# Altium schematic sheet GPIO_NC_INTERFACE.SchDoc
size A4; SheetNumber: 13; SheetTotal: 20
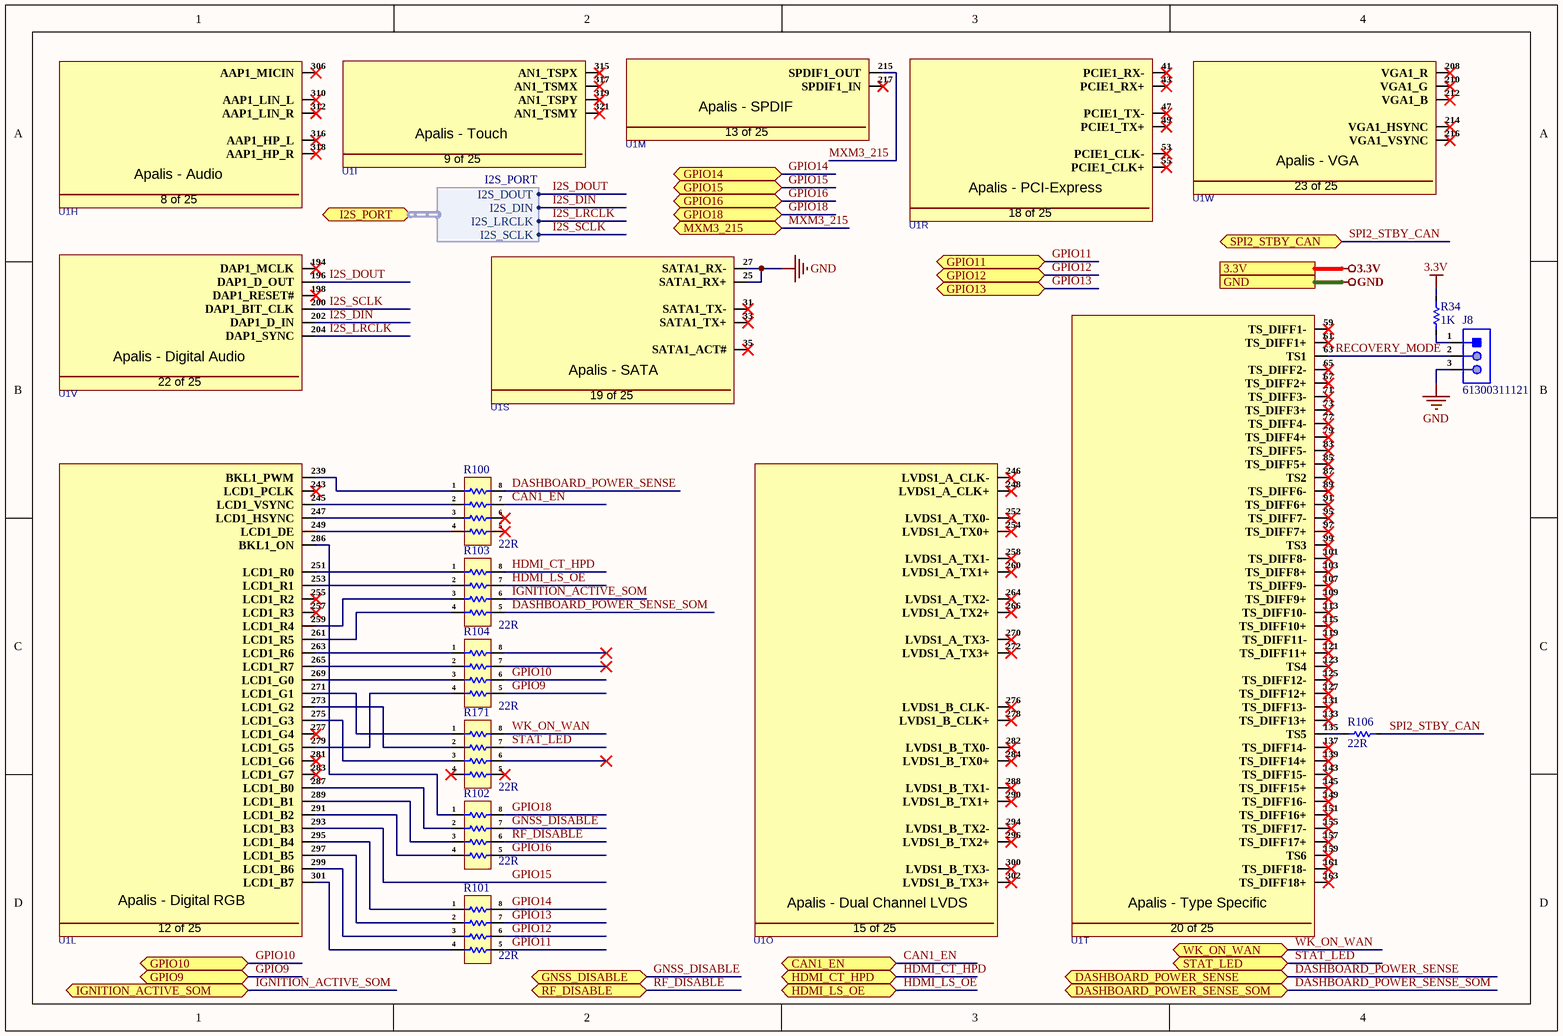
[diagram p0: GPIO_NC_INTERFACE.SchDoc]

## Parts
J8  61300311121  [HDR1X3_]
R34  1K  [Res-0603]
R100  22R  [YC164-JR-0722RL]
R101  22R  [YC164-JR-0722RL]
R102  22R  [YC164-JR-0722RL]
R103  22R  [YC164-JR-0722RL]
R104  22R  [YC164-JR-0722RL]
R106  22R  [Res-0402]
R171  22R  [YC164-JR-0722RL]
U1  MM70-314B1-2-R300  [MM70-314B1-2-R300]  (value not drawn)  (parts H,I,L,M,O,R,S,T,V,W of 25)

## Ports
3.3V (see Top_Sheet[3B], 03-CAN2_SPI_CAN_CONTROLLER[1D], APALIS_POWER_SUPPLY[1D], CAN2_SPI_CAN_CONTROLLER[1D], DC_DC_CONVERTER[1D], I2C_INTERFACE[1B], LTE_MODULE[1D], Reset_and_SDIO[1D]), CAN1_EN (bidir, see Top_Sheet[2B], 03-CAN2_SPI_CAN_CONTROLLER[1D]), DASHBOARD_POWER_SENSE (bidir, see Top_Sheet[3B], CONNECTORS[3D], DIGITAL_I-O_O-P[1D]), DASHBOARD_POWER_SENSE_SOM (bidir, see Top_Sheet[3B], DIGITAL_I-O_O-P[1D]), GND (see Top_Sheet[2B], 03-CAN2_SPI_CAN_CONTROLLER[1D], APALIS_POWER_SUPPLY[1D], CAN2_SPI_CAN_CONTROLLER[1D], CODEC_INTERFACE[1D], CONNECTORS[1D], DC_DC_CONVERTER[1D], DIGITAL_I-O_O-P[1D], ETHERNET_INTERFACE[1D], FUTURE_USE_CONNECTOR[1D], HDMI_INTERFACE[1D], I2C_INTERFACE[1B], INPUT_SUPPLY_PROTECTION[1D], LTE_MODULE[1D], MECHANICAL_FOR_PCB[1D], MICRO_SD_CARD_INTERFACE[1D], Reset_and_SDIO[1D], UART_INTERFACE[1D], USB3.0_INTERFACE[1D]), GNSS_DISABLE (bidir, see Top_Sheet[3C], LTE_MODULE[3D]), GPIO9 (bidir, see Top_Sheet[2C], CONNECTORS[2D], FUTURE_USE_CONNECTOR[3C]), GPIO10 (bidir, see Top_Sheet[2C], FUTURE_USE_CONNECTOR[3C]), GPIO11 (bidir, see Top_Sheet[2C], CONNECTORS[2D], FUTURE_USE_CONNECTOR[3C]), GPIO12 (bidir, see Top_Sheet[2C], CONNECTORS[2D], FUTURE_USE_CONNECTOR[3C]), GPIO13 (bidir, see Top_Sheet[2C], CONNECTORS[2D], FUTURE_USE_CONNECTOR[3C]), GPIO14 (bidir, see Top_Sheet[2C], FUTURE_USE_CONNECTOR[3C]), GPIO15 (bidir, see Top_Sheet[3C], FUTURE_USE_CONNECTOR[3C]), GPIO16 (bidir, see Top_Sheet[3C], FUTURE_USE_CONNECTOR[3D]), GPIO18 (bidir, see Top_Sheet[3B], DIGITAL_I-O_O-P[1D]), HDMI_CT_HPD (bidir, see Top_Sheet[2B], HDMI_INTERFACE[1D]), HDMI_LS_OE (bidir, see Top_Sheet[2C], HDMI_INTERFACE[1D]), I2S_PORT (bidir, harness I2S_PORT, see Top_Sheet[3C], CODEC_INTERFACE[2D]), IGNITION_ACTIVE_SOM (bidir, see Top_Sheet[2C], DIGITAL_I-O_O-P[1D]), MXM3_215 (bidir, see Top_Sheet[3B], CODEC_INTERFACE[4D]), RF_DISABLE (bidir, see Top_Sheet[3C], LTE_MODULE[3D]), SPI2_STBY_CAN (bidir, see Top_Sheet[2C], CAN2_SPI_CAN_CONTROLLER[1D]), STAT_LED (bidir, see Top_Sheet[3C], LTE_MODULE[3D]), WK_ON_WAN (bidir, see Top_Sheet[3C], LTE_MODULE[3D])

## Harnesses
I2S_PORT: I2S_DOUT, I2S_DIN, I2S_LRCLK, I2S_SCLK

## Nets
3.3V: R34.2 ; port 3.3V
GND: J8.3 U1.25(SATA1_RX+) U1.27(SATA1_RX-) ; port GND
CAN1_EN: R100.7 ; port CAN1_EN
DASHBOARD_POWER_SENSE: R100.8 ; port DASHBOARD_POWER_SENSE
DASHBOARD_POWER_SENSE_SOM: R103.5 ; port DASHBOARD_POWER_SENSE_SOM
GNSS_DISABLE: R102.7 ; port GNSS_DISABLE
GPIO9: R104.5 ; port GPIO9
GPIO10: R104.6 ; port GPIO10
GPIO11: R101.5 ; port GPIO11
GPIO12: R101.6 ; port GPIO12
GPIO13: R101.7 ; port GPIO13
GPIO14: R101.8 ; port GPIO14
GPIO15: U1.293(LCD1_B3) ; port GPIO15
GPIO16: R102.5 ; port GPIO16
GPIO18: R102.8 ; port GPIO18
HDMI_CT_HPD: R103.8 ; port HDMI_CT_HPD
HDMI_LS_OE: R103.7 ; port HDMI_LS_OE
I2S_DIN: U1.202(DAP1_D_IN) ; port I2S_PORT.I2S_DIN
I2S_DOUT: U1.196(DAP1_D_OUT) ; port I2S_PORT.I2S_DOUT
I2S_LRCLK: U1.204(DAP1_SYNC) ; port I2S_PORT.I2S_LRCLK
I2S_SCLK: U1.200(DAP1_BIT_CLK) ; port I2S_PORT.I2S_SCLK
IGNITION_ACTIVE_SOM: R103.6 ; port IGNITION_ACTIVE_SOM
MXM3_215: U1.215(SPDIF1_OUT) ; port MXM3_215
RECOVERY_MODE: J8.2 U1.63(TS1)
RF_DISABLE: R102.6 ; port RF_DISABLE
SPI2_STBY_CAN: R106.2 ; port SPI2_STBY_CAN
STAT_LED: R171.7 ; port STAT_LED
WK_ON_WAN: R171.8 ; port WK_ON_WAN
NetJ8_1: J8.1 R34.1
NetR100_1: R100.1 U1.239(BKL1_PWM)
NetR100_2: R100.2 U1.245(LCD1_VSYNC)
NetR100_3: R100.3 U1.247(LCD1_HSYNC)
NetR100_4: R100.4 U1.249(LCD1_DE)
NetR101_1: R101.1 U1.295(LCD1_B4)
NetR101_2: R101.2 U1.297(LCD1_B5)
NetR101_3: R101.3 U1.299(LCD1_B6)
NetR101_4: R101.4 U1.301(LCD1_B7)
NetR102_1: R102.1 U1.286(BKL1_ON)
NetR102_2: R102.2 U1.287(LCD1_B0)
NetR102_3: R102.3 U1.289(LCD1_B1)
NetR102_4: R102.4 U1.291(LCD1_B2)
NetR103_1: R103.1 U1.251(LCD1_R0)
NetR103_2: R103.2 U1.253(LCD1_R1)
NetR103_3: R103.3 U1.259(LCD1_R4)
NetR103_4: R103.4 U1.261(LCD1_R5)
NetR104_1: R104.1 U1.263(LCD1_R6)
NetR104_2: R104.2 U1.265(LCD1_R7)
NetR104_3: R104.3 U1.269(LCD1_G0)
NetR104_4: R104.4 U1.279(LCD1_G5)
NetR106_1: R106.1 U1.135(TS5)
NetR171_1: R171.1 U1.271(LCD1_G1)
NetR171_2: R171.2 U1.273(LCD1_G2)
NetR171_3: R171.3 U1.275(LCD1_G3)

Not connected (* = marked no-connect by the designer): R100 5* 6*; R104 7* 8*; R171 4* 5* 6*; U1 31(SATA1_TX-)* 33(SATA1_TX+)* 35(SATA1_ACT#)* 41(PCIE1_RX-)* 43(PCIE1_RX+)* 47(PCIE1_TX-)* 49(PCIE1_TX+)* 53(PCIE1_CLK-)* 55(PCIE1_CLK+)* 59(TS_DIFF1-)* 61(TS_DIFF1+)* 65(TS_DIFF2-)* 67(TS_DIFF2+)* 71(TS_DIFF3-)* 73(TS_DIFF3+)* 77(TS_DIFF4-)* 79(TS_DIFF4+)* 83(TS_DIFF5-)* 85(TS_DIFF5+)* 87(TS2)* 89(TS_DIFF6-)* 91(TS_DIFF6+)* 95(TS_DIFF7-)* 97(TS_DIFF7+)* 99(TS3)* 101(TS_DIFF8-)* 103(TS_DIFF8+)* 107(TS_DIFF9-)* 109(TS_DIFF9+)* 113(TS_DIFF10-)* 115(TS_DIFF10+)* 119(TS_DIFF11-)* 121(TS_DIFF11+)* 123(TS4)* 125(TS_DIFF12-)* 127(TS_DIFF12+)* 131(TS_DIFF13-)* 133(TS_DIFF13+)* 137(TS_DIFF14-)* 139(TS_DIFF14+)* 143(TS_DIFF15-)* 145(TS_DIFF15+)* 149(TS_DIFF16-)* 151(TS_DIFF16+)* 155(TS_DIFF17-)* 157(TS_DIFF17+)* 159(TS6)* 161(TS_DIFF18-)* 163(TS_DIFF18+)* 194(DAP1_MCLK)* 198(DAP1_RESET#)* 208(VGA1_R)* 210(VGA1_G)* 212(VGA1_B)* 214(VGA1_HSYNC)* 216(VGA1_VSYNC)* 217(SPDIF1_IN)* 243(LCD1_PCLK)* 246(LVDS1_A_CLK-)* 248(LVDS1_A_CLK+)* 252(LVDS1_A_TX0-)* 254(LVDS1_A_TX0+)* 255(LCD1_R2)* 257(LCD1_R3)* 258(LVDS1_A_TX1-)* 260(LVDS1_A_TX1+)* 264(LVDS1_A_TX2-)* 266(LVDS1_A_TX2+)* 270(LVDS1_A_TX3-)* 272(LVDS1_A_TX3+)* 276(LVDS1_B_CLK-)* 277(LCD1_G4)* 278(LVDS1_B_CLK+)* 281(LCD1_G6)* 282(LVDS1_B_TX0-)* 283(LCD1_G7)* 284(LVDS1_B_TX0+)* 288(LVDS1_B_TX1-)* 290(LVDS1_B_TX1+)* 294(LVDS1_B_TX2-)* 296(LVDS1_B_TX2+)* 300(LVDS1_B_TX3-)* 302(LVDS1_B_TX3+)* 306(AAP1_MICIN)* 310(AAP1_LIN_L)* 312(AAP1_LIN_R)* 315(AN1_TSPX)* 316(AAP1_HP_L)* 317(AN1_TSMX)* 318(AAP1_HP_R)* 319(AN1_TSPY)* 321(AN1_TSMY)*

## Notes on the sheet
- (in symbol MM70-314B1-2-R300, part H) Apalis - Audio; 8 of 25
- (in symbol MM70-314B1-2-R300, part I) Apalis - Touch; 9 of 25
- (in symbol MM70-314B1-2-R300, part L) Apalis - Digital RGB; 12 of 25
- (in symbol MM70-314B1-2-R300, part M) Apalis - SPDIF; 13 of 25
- (in symbol MM70-314B1-2-R300, part O) Apalis - Dual Channel LVDS; 15 of 25
- (in symbol MM70-314B1-2-R300, part R) Apalis - PCI-Express; 18 of 25
- (in symbol MM70-314B1-2-R300, part S) Apalis - SATA; 19 of 25
- (in symbol MM70-314B1-2-R300, part T) Apalis - Type Specific; 20 of 25
- (in symbol MM70-314B1-2-R300, part V) Apalis - Digital Audio; 22 of 25
- (in symbol MM70-314B1-2-R300, part W) Apalis - VGA; 23 of 25

## Library data of the parts
J8 = 61300311121: CONN HEADER VERT 3POS 2.54MM; Manufacturer: Wurth Electronics; Number of Positions: 3; Gender: Male; Connector Type: Male Pin; Pitch: 0.1inch; Item Type: Male Header; Supplier 1: Digi-Key; Manufacturer Part Number: 61300311121; Stock 1: 81286; Pricing 1: 1=0.13, 10=0.106, 25=0.088, 50=0.074, 100=0.067, 1000=0.061 (USD); Mount: Through Hole; Contact Plating: Gold; Contact Material: Copper; Color: Black; Number of Rows: 1; Packaging: Bulk; Termination: Solder; Number of Contacts: 3; Contact Mating Length: 0.236inch; REACH SVHC: Unknown; Lead Free: Lead Free; ComponentLink1URL: http://www.farnell.com/cad/1737268.pdf?src-supplier=Element14; ComponentLink1Description: http://www.farnell.com/cad/1737268.pdf?src-supplier=Element14; ComponentLink2URL: https://katalog.we-online.de/em/datasheet/6130xx11121.pdf?src-supplier=Digi-Key; ComponentLink2Description: https://katalog.we-online.de/em/datasheet/6130xx11121.pdf?src-supplier=Digi-Key; Supplier Part Number 1: 732-5316-ND
R34 = RT0603BRD071KL: RES SMD 1K OHM 0.1% 1/10W 0603; Manufacturer: Yageo; Resistance: 1kR; Power Rating: 100mW; Voltage Rating: 75V; Temperature Coefficient: 25ppm/°C; Voltage Rating (DC): 50V; Item Type: Resistor; Supplier 1: Arrow Electronics; Manufacturer Part Number: RT0603BRD071KL; RoHS: Yes; Category: Chip SMD Resistors; Stock 1: 130000; Pricing 1: 5000=0.03900, 10000=0.03450, 25000=0.03070, 50000=0.02040 (USD); Mount: Surface Mount; Case/Package: 0603; Case Code (Metric): 1608; Case Code (Imperial): 0603; Contact Plating: Tin,Lead; Size Code: 0603; Min Operating Temperature: -55°C; Max Operating Temperature: 125°C; Package Quantity: 5000; Packaging: Tape and Reel; Resistor Type: Thin Film; Number of Terminations: 2; Termination: SMD/SMT; Max Power Dissipation: 100mW; Features: Moisture Resistant; Series: RT; Technology: THIN FILM; Construction: Rectangular; Length: 1.6mm; Width: 0.031inch; Height: 0.022inch; Depth: 0.8mm; Military Standard: Not; Lead Free: Lead Free; RoHS Compliant: Yes; ComponentLink1URL: https://datasheet.ciiva.com/11819/0900766b8079c86e-11819652.pdf?src-supplier=RSComponents; ComponentLink1Description: https://datasheet.ciiva.com/11819/0900766b8079c86e-11819652.pdf?src-supplier=RSComponents; ComponentLink2URL: https://datasheet.ciiva.com/5624/pyu-rt-1-to-0-05-rohs-l-4-5624759.pdf?src-supplier=Mouser; ComponentLink2Description: https://datasheet.ciiva.com/5624/pyu-rt-1-to-0-05-rohs-l-4-5624759.pdf?src-supplier=Mouser; ComponentLink3URL: https://datasheet.ciiva.com/29718/pyu-rt-1-to-0-05-rohs-l-4-29718010.pdf?src-supplier=Digi-Key; ComponentLink3Description: https://datasheet.ciiva.com/29718/pyu-rt-1-to-0-05-rohs-l-4-29718010.pdf?src-supplier=Digi-Key; ComponentLink4URL: https://datasheet.ciiva.com/29718/pyu-rt-1-to-0-05-rohs-l-4-29718011.pdf?src-supplier=Digi-Key; ComponentLink4Description: https://datasheet.ciiva.com/29718/pyu-rt-1-to-0-05-rohs-l-4-29718011.pdf?src-supplier=Digi-Key; Supplier Part Number 1: RT0603BRD071KL; LCSC Part Number: C110776
R100-R104 R171 = YC164-JR-0722RL: RES ARRAY 4 RES 22 OHM 1206; Manufacturer: Yageo; Supplier: Future Electronics; Supplier Part Number: 4472155; Manufacturer Part Number: YC164-JR-0722RL; RoHS: Yes; Category: Resistor Arrays; Stock: 225000; Pricing: 5000=0.0084, 20000=0.008, 50000=0.0078, 125000=0.0075, 200000=0.0071 (USD); ComponentLink1URL: https://datasheet.ciiva.com/8018/443424-8018007.pdf?src-supplier=Element14; ComponentLink1Description: https://datasheet.ciiva.com/8018/443424-8018007.pdf?src-supplier=Element14; ComponentLink2URL: https://datasheet.ciiva.com/8018/443424-8018008.pdf?src-supplier=Element14; ComponentLink2Description: https://datasheet.ciiva.com/8018/443424-8018008.pdf?src-supplier=Element14; ComponentLink3URL: https://datasheet.ciiva.com/2688/pyu-yc-tc164-51-rohs-l-3-2688422.pdf?src-supplier=Digi-Key; ComponentLink3Description: https://datasheet.ciiva.com/2688/pyu-yc-tc164-51-rohs-l-3-2688422.pdf?src-supplier=Digi-Key; ComponentLink4URL: https://datasheet.ciiva.com/2688/pyu-yc-tc164-51-rohs-l-3-2688421.pdf?src-supplier=Digi-Key; ComponentLink4Description: https://datasheet.ciiva.com/2688/pyu-yc-tc164-51-rohs-l-3-2688421.pdf?src-supplier=Digi-Key; ComponentLink5URL: https://datasheet.ciiva.com/8320/pyu-yc-tc164-51-rohs-l-3-8320230.pdf?src-supplier=Avnet; ComponentLink5Description: https://datasheet.ciiva.com/8320/pyu-yc-tc164-51-rohs-l-3-8320230.pdf?src-supplier=Avnet; ComponentLink6URL: https://datasheet.ciiva.com/2688/pyu-yc-tc164-51-rohs-l-3-2688423.pdf?src-supplier=Digi-Key; ComponentLink6Description: https://datasheet.ciiva.com/2688/pyu-yc-tc164-51-rohs-l-3-2688423.pdf?src-supplier=Digi-Key; ComponentLink7URL: https://datasheet.ciiva.com/17030/pyu-yc-tc164-51-rohs-l-3-17030158.pdf?src-supplier=Future+Electronics; ComponentLink7Description: https://datasheet.ciiva.com/17030/pyu-yc-tc164-51-rohs-l-3-17030158.pdf?src-supplier=Future+Electronics; ComponentLink8URL: https://datasheet.ciiva.com/28379/pyu-yc-tc164-51-rohs-l-3-28379358.pdf?; ComponentLink8Description: https://datasheet.ciiva.com/28379/pyu-yc-tc164-51-rohs-l-3-28379358.pdf?
R106 = CRGCQ0402J22R: RES 22 OHM 5% 1/16W 0402; Manufacturer: TE Connectivity; Supplier: Avnet; Supplier Part Number: 73AC8982; Manufacturer Part Number: CRGCQ0402J22R; RoHS: Yes; Category: Chip SMD Resistors; Stock: 20000; Pricing: 1=0.036, 25=0.01, 100=0.008, 250=0.006, 500=0.005 (USD); ComponentLink1URL: https://www.te.com/commerce/DocumentDelivery/DDEController?Action=srchrtrv&amp;DocNm=1773204-3&amp;DocType=DS&amp;DocLang=English&src-supplier=Digi-Key; ComponentLink1Description: https://www.te.com/commerce/DocumentDelivery/DDEController?Action=srchrtrv&amp;DocNm=1773204-3&amp;DocType=DS&amp;DocLang=English&src-supplier=Digi-Key; ComponentLink2URL: https://4donline.ihs.com/images/VipMasterIC/IC/TYEL/TYEL-S-A0004929575/TYEL-S-A0004929575-1.pdf?hkey=52A5661711E402568146F3353EA87419&src-supplier=Newark; ComponentLink2Description: https://4donline.ihs.com/images/VipMasterIC/IC/TYEL/TYEL-S-A0004929575/TYEL-S-A0004929575-1.pdf?hkey=52A5661711E402568146F3353EA87419&src-supplier=Newark; ComponentLink3URL: https://4donline.ihs.com/images/VipMasterIC/IC/TYEL/TYEL-S-A0004929575/TYEL-S-A0004929575-1.pdf?hkey=52A5661711E402568146F3353EA87419&src-supplier=Element14; ComponentLink3Description: https://4donline.ihs.com/images/VipMasterIC/IC/TYEL/TYEL-S-A0004929575/TYEL-S-A0004929575-1.pdf?hkey=52A5661711E402568146F3353EA87419&src-supplier=Element14; ComponentLink4URL: https://datasheet.octopart.com/CRGCQ0402J22R-TE-Connectivity-datasheet-114679081.pdf?src-supplier=Master+Electronics; ComponentLink4Description: https://datasheet.octopart.com/CRGCQ0402J22R-TE-Connectivity-datasheet-114679081.pdf?src-supplier=Master+Electronics
U1 = MM70-314B1-2-R300: CONN MXM 3.0 FMALE 314POS 0.020; Manufacturer: JAE Electronics; Supplier: Digi-Key; Supplier Part Number: 670-MM70-314B1-2-R300CT-ND; Manufacturer Part Number: MM70-314B1-2-R300; RoHS: No; Category: Card Edge Connectors; Stock: 4979; Pricing: 1=9.21, 10=8.287, 25=7.8064, 50=7.6064, 100=7.4062 (USD)